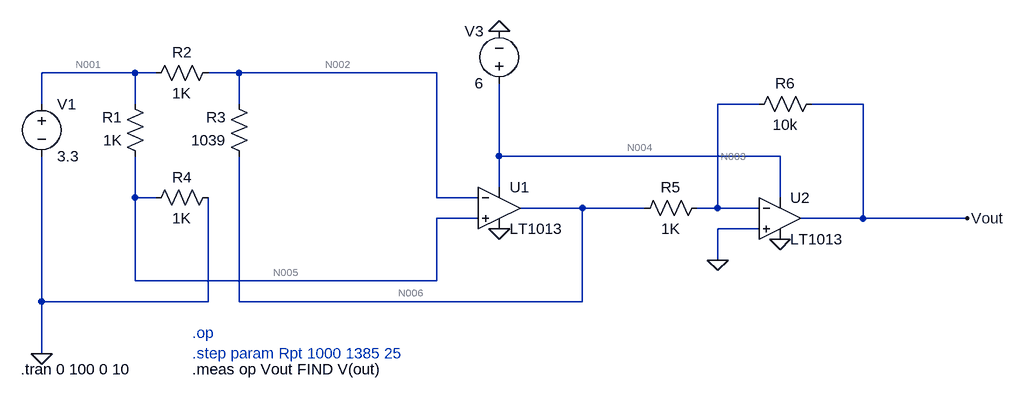
[diagram p0: schematic semi open wheatstone bridge.asc]
semi open wheatstone bridge.asc, the LTspice schematic file:
Version 4.1
SHEET 1 1464 680
WIRE 112 80 -32 80
WIRE 144 80 112 80
WIRE 272 80 224 80
WIRE 576 80 272 80
WIRE -32 128 -32 80
WIRE 112 128 112 80
WIRE 272 128 272 80
WIRE 1072 128 1008 128
WIRE 1232 128 1152 128
WIRE 672 208 672 96
WIRE 1104 208 672 208
WIRE 672 256 672 208
WIRE 112 272 112 208
WIRE 144 272 112 272
WIRE 576 272 576 80
WIRE 640 272 576 272
WIRE 1104 272 1104 208
WIRE 800 288 704 288
WIRE 896 288 800 288
WIRE 1008 288 1008 128
WIRE 1008 288 976 288
WIRE 1072 288 1008 288
WIRE 640 304 576 304
WIRE 1232 304 1232 128
WIRE 1232 304 1136 304
WIRE 1392 304 1232 304
WIRE 1072 320 1008 320
WIRE 1008 368 1008 320
WIRE 112 400 112 272
WIRE 576 400 576 304
WIRE 576 400 112 400
WIRE -32 432 -32 208
WIRE 224 432 224 272
WIRE 224 432 -32 432
WIRE 272 432 272 208
WIRE 800 432 800 288
WIRE 800 432 272 432
WIRE -32 512 -32 432
FLAG -32 512 0
FLAG 672 16 0
FLAG 1008 368 0
FLAG 1392 304 Vout
FLAG 1104 336 0
FLAG 672 320 0
SYMBOL voltage -32 112 R0
WINDOW 123 0 0 Left 0
WINDOW 39 0 0 Left 0
SYMATTR InstName V1
SYMATTR Value 3.3
SYMBOL res 240 64 R90
WINDOW 0 0 56 VBottom 2
WINDOW 3 32 56 VTop 2
SYMATTR InstName R2
SYMATTR Value 1K
SYMBOL res 240 256 R90
WINDOW 0 0 56 VBottom 2
WINDOW 3 32 56 VTop 2
SYMATTR InstName R4
SYMATTR Value 1K
SYMBOL res 128 224 R180
WINDOW 0 36 76 Left 2
WINDOW 3 36 40 Left 2
SYMATTR InstName R1
SYMATTR Value 1K
SYMBOL res 288 224 R180
WINDOW 0 36 76 Left 2
WINDOW 3 36 40 Left 2
SYMATTR InstName R3
SYMATTR Value 1039
SYMBOL voltage 672 112 R180
WINDOW 0 24 96 Left 2
WINDOW 3 24 16 Left 2
WINDOW 123 0 0 Left 0
WINDOW 39 0 0 Left 0
SYMATTR InstName V3
SYMATTR Value 6
SYMBOL res 992 272 R90
WINDOW 0 0 56 VBottom 2
WINDOW 3 32 56 VTop 2
SYMATTR InstName R5
SYMATTR Value 1K
SYMBOL res 1168 112 R90
WINDOW 0 0 56 VBottom 2
WINDOW 3 32 56 VTop 2
SYMATTR InstName R6
SYMATTR Value 10k
SYMBOL OpAmps\\LT1013 672 224 R0
SYMATTR InstName U1
SYMBOL OpAmps\\LT1013 1104 240 R0
SYMATTR InstName U2
TEXT -64 536 Left 2 !.tran 0 100 0 10
TEXT 200 480 Left 2 ;.op\n.step param Rpt 1000 1385 25
TEXT 200 536 Left 2 !.meas op Vout FIND V(out)

The netlist it stands for:
* semi open wheatstone bridge.asc
V1 N001 0 3.3
R2 N002 N001 1K
R4 0 N005 1K
R1 N005 N001 1K
R3 N006 N002 1039
V3 N004 0 6
R5 N003 N006 1K
R6 Vout N003 10k
X§U1 N005 N002 N004 0 N006 LT1013  ; pins In+ In- V+ V- OUT
X§U2 0 N003 N004 0 Vout LT1013  ; pins In+ In- V+ V- OUT
.tran 0 100 0 10
* .op
* .step param Rpt 1000 1385 25
.meas op Vout FIND V(out)
.lib LTC.lib
.backanno
.end

* Results of the author's LTspice run, read from the files saved beside the schematic
* Operating Point, zero values left out:
*   V(n001) = 3.3 V
*   V(n002) = 1.742 V
*   V(n003) = 113.4 mV
*   V(n004) = 6 V
*   V(n005) = 1.65 V
*   V(n006) = 123.1 mV
*   V(vout) = 16.15 mV
*   I(R1) = -1.65 mA
*   I(R2) = -1.558 mA
*   I(R3) = -1.558 mA
*   I(R4) = -1.65 mA
*   I(R5) = -9.71 µA
*   I(R6) = -9.722 µA
*   I(V1) = -3.208 mA
*   I(V3) = -136.7 µA
*   Ix(u1:1) = -12.35 nA
*   Ix(u1:2) = -11.92 nA
*   Ix(u1:3) = 24.5 nA
*   Ix(u1:4) = -1.54 mA
*   Ix(u1:5) = 1.548 mA
*   Ix(u2:1) = -12.56 nA
*   Ix(u2:2) = -12.03 nA
*   Ix(u2:3) = 136.6 µA
*   Ix(u2:4) = -137.2 µA
*   Ix(u2:5) = 9.722 µA